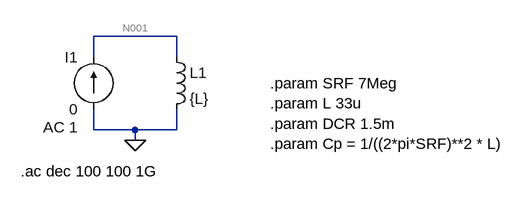
[diagram p0: schematic Inductor_Test.asc]
Inductor_Test.asc, the LTspice schematic file:
Version 4.1
SHEET 1 880 680
WIRE 160 128 32 128
WIRE 32 160 32 128
WIRE 160 160 160 128
WIRE 32 272 32 240
WIRE 96 272 32 272
WIRE 160 272 160 240
WIRE 160 272 96 272
WIRE 96 288 96 272
FLAG 96 288 0
SYMBOL ind 144 144 R0
SYMATTR InstName L1
SYMATTR Value {L}
SYMATTR SpiceLine Rser={DCR} Cpar={Cp}
SYMBOL current 32 240 R180
WINDOW 0 24 80 Left 2
WINDOW 3 24 0 Left 2
WINDOW 123 24 -28 Left 2
WINDOW 39 0 0 Left 0
SYMATTR InstName I1
SYMATTR Value 0
SYMATTR Value2 AC 1
TEXT 304 200 Left 2 !.param SRF 7Meg\n.param L 33u\n.param DCR 1.5m\n.param Cp = 1/((2*pi*SRF)**2 * L)
TEXT -80 336 Left 2 !.ac dec 100 100 1G

The netlist it stands for:
* Inductor_Test.asc
L1 N001 0 {L} Rser={DCR} Cpar={Cp}
I1 0 N001 0 AC 1
.param SRF 7Meg
.param L 33u
.param DCR 1.5m
.param Cp = 1/((2*pi*SRF)**2 * L)
.ac dec 100 100 1G
.backanno
.end

* Results of the author's LTspice run, read from the files saved beside the schematic
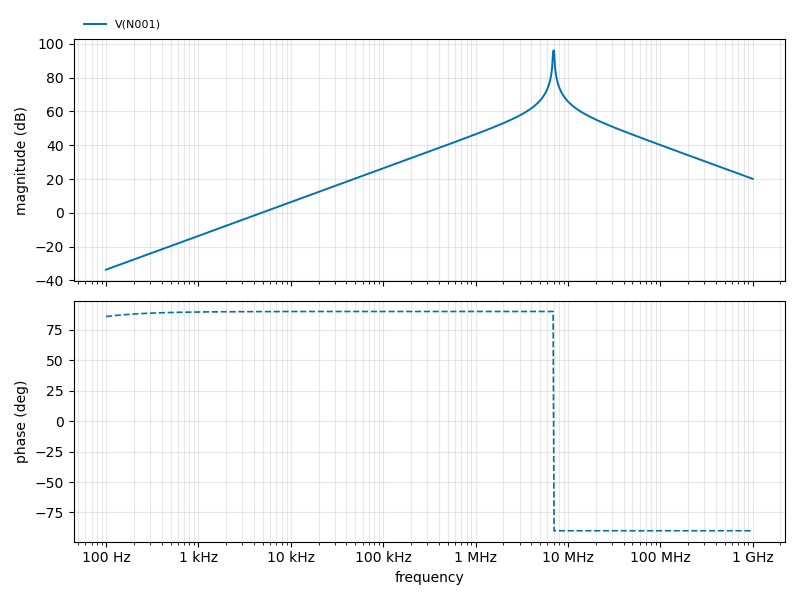
[diagram p1: AC Analysis of Inductor_Test.asc, plotted from the saved traces]
* AC Analysis, 1 run:
*   V(N001): -33.64 dB at 100 Hz, 20.14 dB at 1 GHz, peak 96.16 dB at 7.079 MHz, 3 dB below the peak at 6.873 MHz and 7.13 MHz